# Altium schematic sheet Top_Sheet.SchDoc
size A4; DocumentNumber: 1; SheetNumber: 1
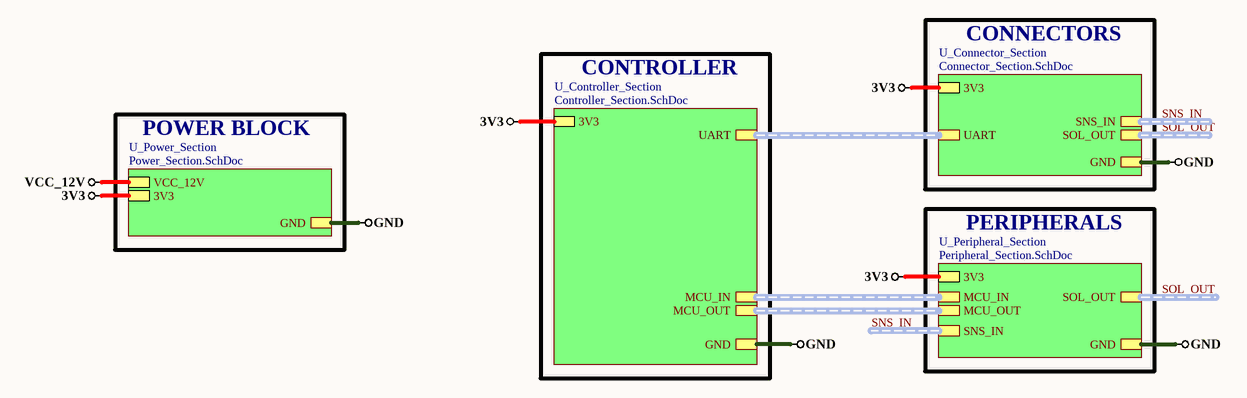
[diagram p0: Top_Sheet.SchDoc]

## Sub-sheets
U_Connector_Section = Connector_Section.SchDoc: UART (harness UART), 3V3, GND, SNS_IN (harness SNS_IN), SOL_OUT (harness SOL_OUT)
U_Controller_Section = Controller_Section.SchDoc: 3V3, GND, UART (harness UART), MCU_OUT (harness MCU_OUT), MCU_IN (harness MCU_IN)
U_Peripheral_Section = Peripheral_Section.SchDoc: MCU_IN (harness MCU_IN), MCU_OUT (harness MCU_OUT), 3V3, GND, SNS_IN (harness SNS_IN), SOL_OUT (harness SOL_OUT)
U_Power_Section = Power_Section.SchDoc: 3V3, GND, VCC_12V

## Nets
3V3: sheet U_Controller_Section/3V3, sheet U_Peripheral_Section/3V3, sheet U_Power_Section/3V3, sheet U_Connector_Section/3V3
GND: sheet U_Controller_Section/GND, sheet U_Peripheral_Section/GND, sheet U_Power_Section/GND, sheet U_Connector_Section/GND
VCC_12V: sheet U_Power_Section/VCC_12V

## Buses and harness runs
harness sheet U_Connector_Section/UART = sheet U_Controller_Section/UART
harness sheet U_Controller_Section/MCU_IN = sheet U_Peripheral_Section/MCU_IN
harness sheet U_Controller_Section/MCU_OUT = sheet U_Peripheral_Section/MCU_OUT
harness SNS_IN = sheet U_Connector_Section/SNS_IN
harness SNS_IN = sheet U_Peripheral_Section/SNS_IN
harness SOL_OUT = sheet U_Connector_Section/SOL_OUT
harness SOL_OUT = sheet U_Peripheral_Section/SOL_OUT

## Notes on the sheet
- CONTROLLER
- CONNECTORS
- POWER BLOCK
- PERIPHERALS